# Altium project PGS-System.PrjPcb (part 14 of 16)

## Sheet IR-CUT_LIGHT SENSOR_SHEET.SchDoc
size A4; SheetNumber: 24; SheetTotal: 26
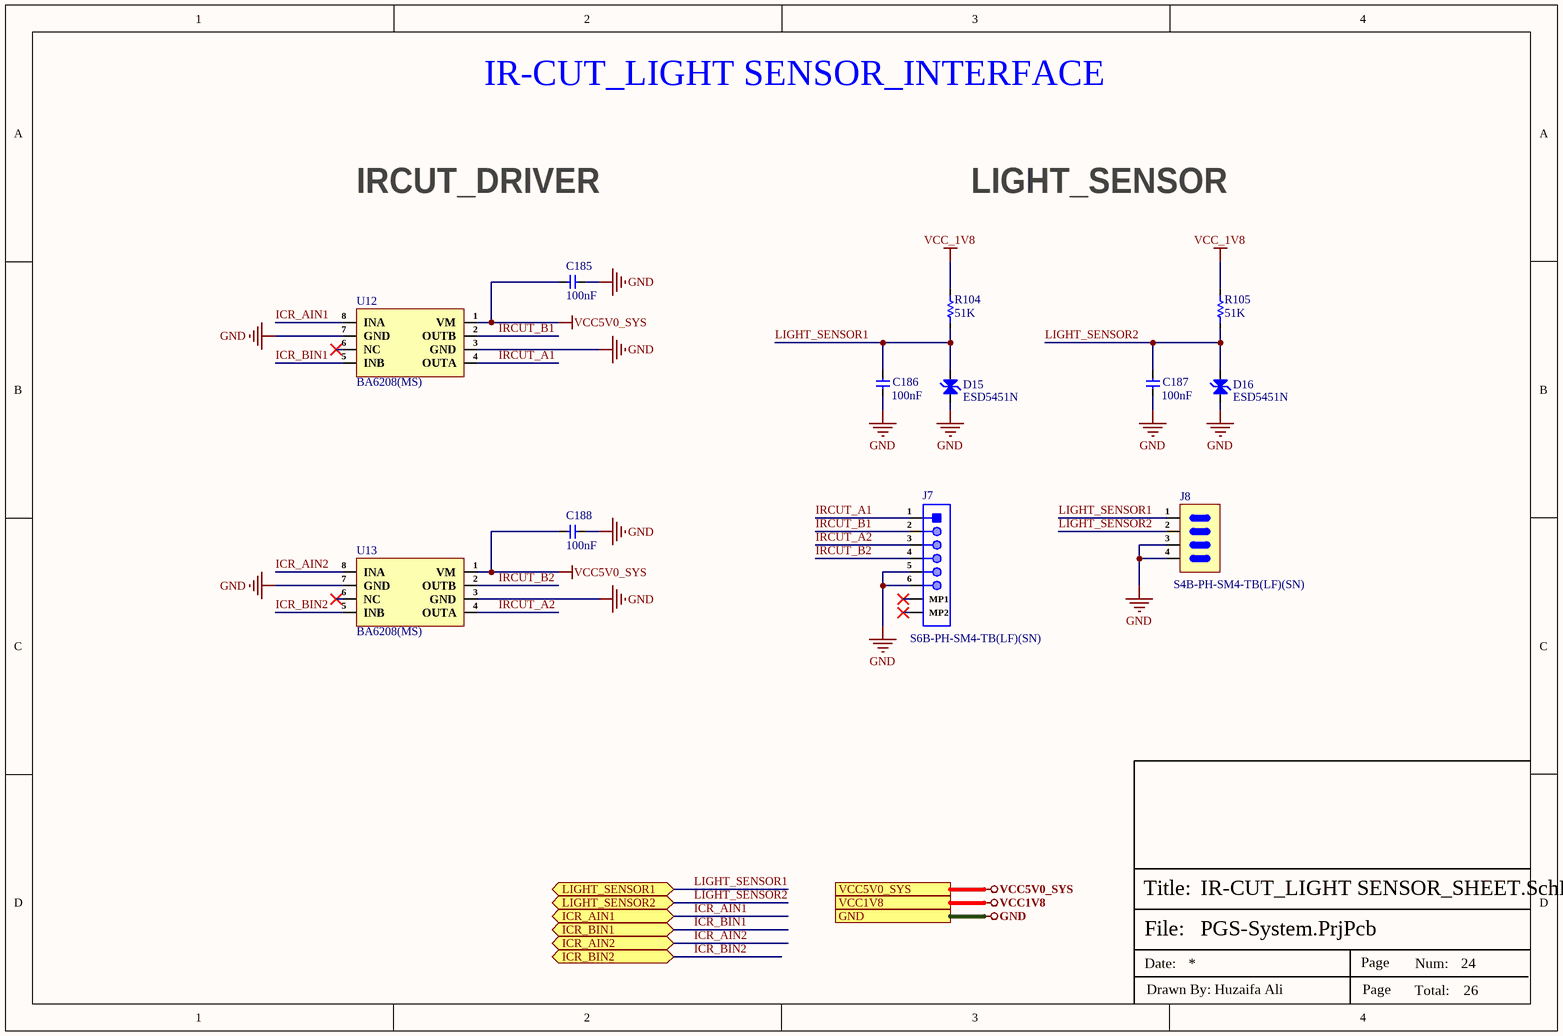
[diagram p25: IR-CUT_LIGHT SENSOR_SHEET.SchDoc]

### Parts
C185  100nF  [Cap-0402]
C186  100nF  [Cap-0402]
C187  100nF  [Cap-0402]
C188  100nF  [Cap-0402]
D15  ESD5451N  [DFN1006-2L (Bi-Directional)]
D16  ESD5451N  [DFN1006-2L (Bi-Directional)]
J7  S6B-PH-SM4-TB(LF)(SN)  [S6B-PH-SM4-TB(LF)(SN)]
J8  S4B-PH-SM4-TB(LF)(SN)  [S4B-PH-SM4-TB(LF)(SN)]
R104  51K  [Res-0402]
R105  51K  [Res-0402]
U12  BA6208(MS)  [SOIC-8(0.154", 3.90mm Width)]
U13  BA6208(MS)  [SOIC-8(0.154", 3.90mm Width)]

### Ports
GND (see DDR3_SDRAM_INTERFACE[4D], DEBUG_UART_INTERFACE[3D], DIGITAL_MEMS_MIC_INTERFACE[3D], eMMC_INTERFACE[3D], ETHERNET_SWITCH_INTERFACE[5C], MIPI TO HDMI_MODULE_INTERFACE[3D], MIPI-CSI_RXX_INTERFACE[4C], PoE PD INTERFACE[3D], PoE_PSE_CONTROLLER[5D], POWER_LDO_SHEET[3D], POWER_PMIC_RK809_CODEC[3D], POWER_PMIC_RK809_DC DC[3D], POWER_PMIC_RK809_LDO[4C], POWER_PMIC_RK809_MANAGEMENT[3D], RV1126_AUDIO_SHEET[3D], RV1126_DRAM_SHEET[4C], RV1126_eMMC_SPI-FLASH_SHEET[3D], RV1126_ETHERNET_SHEET[3D], RV1126_OSC-PLL-PMUIO[3C], RV1126_POWER_SHEET[1D], RV1126_SARADC_SHEET[3C], SPI_FLASH_INTERFACE[3D], SYNCHRONOUS _BUCK_CONTROLLER[3D], USB2.0_DEBUG_UART[3D], WIFI_AP6256_SHEET[4D]), ICR_AIN1 (bidir, see RV1126_SARADC_SHEET[3D]), ICR_AIN2 (bidir, see RV1126_SARADC_SHEET[3D]), ICR_BIN1 (bidir, see RV1126_SARADC_SHEET[3D]), ICR_BIN2 (bidir, see RV1126_SARADC_SHEET[3D]), LIGHT_SENSOR1 (bidir, see RV1126_SARADC_SHEET[3D]), LIGHT_SENSOR2 (bidir, see RV1126_SARADC_SHEET[3D]), VCC1V8 (see DIGITAL_MEMS_MIC_INTERFACE[3D], MIPI TO HDMI_MODULE_INTERFACE[3D], MIPI-CSI_RXX_INTERFACE[4C], POWER_PMIC_RK809_LDO[4C], POWER_PMIC_RK809_MANAGEMENT[3D], RV1126_AUDIO_SHEET[3D], RV1126_ETHERNET_SHEET[3D], RV1126_OSC-PLL-PMUIO[3C], RV1126_SARADC_SHEET[3C], USB2.0_DEBUG_UART[3D], WIFI_AP6256_SHEET[4D]), VCC5V0_SYS (see MIPI TO HDMI_MODULE_INTERFACE[3D], POWER_LDO_SHEET[3D], POWER_PMIC_RK809_CODEC[3D], POWER_PMIC_RK809_DC DC[3D], POWER_PMIC_RK809_LDO[4C], POWER_PMIC_RK809_MANAGEMENT[3D], RV1126_OSC-PLL-PMUIO[3C], SYNCHRONOUS _BUCK_CONTROLLER[3D], USB2.0_DEBUG_UART[3D])

### Nets
GND: C185.1 C186.1 C187.1 C188.1 D15.1(K) D16.1(K) J7.5 J7.6 J8.3 J8.4 U12.3(GND) U12.7(GND) U13.3(GND) U13.7(GND) ; port GND  [project net KSENSD]
VCC5V0_SYS: C185.2 C188.2 U12.1(VM) U13.1(VM) ; port VCC5V0_SYS
VCC_1V8: R104.2 R105.2
ICR_AIN1: U12.8(INA) ; port ICR_AIN1
ICR_AIN2: U13.8(INA) ; port ICR_AIN2
ICR_BIN1: U12.5(INB) ; port ICR_BIN1
ICR_BIN2: U13.5(INB) ; port ICR_BIN2
IRCUT_A1: J7.1 U12.4(OUTA)
IRCUT_A2: J7.3 U13.4(OUTA)
IRCUT_B1: J7.2 U12.2(OUTB)
IRCUT_B2: J7.4 U13.2(OUTB)
LIGHT_SENSOR1: C186.2 D15.2(K) J8.1 R104.1 ; port LIGHT_SENSOR1
LIGHT_SENSOR2: C187.2 D16.2(K) J8.2 R105.1 ; port LIGHT_SENSOR2

Not connected (* = marked no-connect by the designer): J7 MP1* MP2*; U12 6(NC)*; U13 6(NC)*

### Notes on the sheet
- IR-CUT_LIGHT SENSOR_INTERFACE
- IRCUT_DRIVER
- LIGHT_SENSOR
- File:
- Title:
- Date:
- Page
- Num:
- Total:
- Drawn By: Huzaifa Ali

### Library data of the parts
C185-C188 = CC0402KRX5R7BB104: as C121 on sheet ETH_SWITCH_INTERFACE; Supplier 1: Mouser; Manufacturer Part Number: CC0402KRX5R7BB104; RoHS: Yes; Category: Ceramic Capacitors; Stock 1: 936792; Pricing 1: 1=0.10000, 10=0.02300, 50=0.02300, 100=0.01100, 1000=0.00600, 10000=0.00400 (USD); Mount: Surface Mount; Case/Package: 0402; Case Code (Imperial): 0402; Case Code (Metric): 1005; Min Operating Temperature: -55°C; Max Operating Temperature: 85°C; Capacitance: 100nF; Packaging: Tape and Reel; Voltage Rating: 16V; Dielectric: X5R; Termination: SMD/SMT; Voltage Rating (DC): 16V; Package Quantity: 1; Length: 1mm; Width: 0.02inch; Thickness: 0.022inch; Lead Free: Lead Free; Halogen Free: Halogen Free; ComponentLink1URL: https://datasheet.ciiva.com/155/mlccorderingcode-155879.pdf?src-supplier=Digi-Key; ComponentLink1Description: https://datasheet.ciiva.com/155/mlccorderingcode-155879.pdf?src-supplier=Digi-Key; ComponentLink2URL: https://datasheet.ciiva.com/155/mlccorderingcode-155878.pdf?src-supplier=Digi-Key; ComponentLink2Description: https://datasheet.ciiva.com/155/mlccorderingcode-155878.pdf?src-supplier=Digi-Key; ComponentLink3URL: https://datasheet.ciiva.com/155/mlccorderingcode-155880.pdf?src-supplier=Digi-Key; ComponentLink3Description: https://datasheet.ciiva.com/155/mlccorderingcode-155880.pdf?src-supplier=Digi-Key; Supplier Part Number 1: 603-CC402KRX5R7BB104; LCSC Part Number: C106204; Number of Pins: 2; Resistor Type: Ceramic; Series: CC; Construction: Flat; Height: 0.5mm; Depth: 0.5mm; Radiation Hardening: No; REACH SVHC: Unknown; RoHS Compliant: Yes; ComponentLink4URL: https://datasheet.ciiva.com/11464/upy-gphc-x5r-4v-to-50v-12-11464869.pdf?src-supplier=Avnet; ComponentLink4Description: https://datasheet.ciiva.com/11464/upy-gphc-x5r-4v-to-50v-12-11464869.pdf?src-supplier=Avnet
D15 D16 = ESD5451N: as D33 on sheet SPEARKER_INTERFACE_SHEET; Manufacturer Part Number: ESD5451N; Footprint: DFN1006-2(0402); ComponentLink1Description: LCSC; ComponentLink1URL: https://www.lcsc.com/product-detail/span-style-background-color-ff0-ESD-span-Protection-Devices_TECH-PUBLIC-ESD5451N_C2936977.html; LCSC Part Number: C2936977
J7 = S6B-PH-SM4-TB(LF)(SN): CONN HEADER SMD R/A 6POS 2MM; Manufacturer: JST; Contact Resistance: 20mR; Max Current Rating: 2A; Number of Poles: 6; Voltage Rating (AC): 100V; Insulation Resistance: 1GR; Gender: Male; Item Type: JST Connector; Supplier 1: Rs; Manufacturer Part Number: S6B-PH-SM4-TB(LF)(SN); RoHS: Yes; Category: Connectors; Stock 1: 8280; Pricing 1: 125=0.16040, 500=0.65000, 2500=0.61200, 5000=0.58600 (GBP); Mounting Technology: Surface Mount; Contact Material: Copper Alloy,Tin,Bronze,Brass; Contact Plating: Tin,Copper; Color: White; Housing Color: Beige; Housing Material: Polyamide; Contact Shape: Square; Insulation Material: Nylon; Insulation Color: Natural; Contact Finish - Mating: TIN; Min Operating Temperature: -25°C; Max Operating Temperature: 85°C; Number of Rows: 1; Packaging: Tape and Reel; Current Rating: 2A; Voltage Rating: 100V; Number of Positions: 6; Termination: Solder; Fastening Type: Detent; Max Voltage Rating (AC): 100V; Number of Contacts: 6; Working Voltage: 100V; Max Voltage Rating (DC): 100V; Orientation: Right Angle; Connector Type: Header; Series: PH; Contact Type: Male Pin; Length: 15.9mm; Width: 5mm; Height: 9.4mm; Lead Pitch: 2mm; Pitch: 2mm; Contact Mating Length: 0.13inch; Depth: 7.6mm; Reach SVHC Compliant: Yes; Lead Free: Lead Free; Flammability Rating: UL94 V-0; ComponentLink1URL: https://datasheet.ciiva.com/11747/0900766b80df0d9d-11747278.pdf?src-supplier=Rs; ComponentLink1Description: https://datasheet.ciiva.com/11747/0900766b80df0d9d-11747278.pdf?src-supplier=Rs; ComponentLink2URL: https://datasheet.ciiva.com/8052/1699381-8052221.pdf?src-supplier=Element14; ComponentLink2Description: https://datasheet.ciiva.com/8052/1699381-8052221.pdf?src-supplier=Element14; ComponentLink3URL: https://datasheet.ciiva.com/712/eph-712622.pdf?src-supplier=Digi-Key; ComponentLink3Description: https://datasheet.ciiva.com/712/eph-712622.pdf?src-supplier=Digi-Key; ComponentLink4URL: https://datasheet.ciiva.com/712/eph-712623.pdf?src-supplier=Digi-Key; ComponentLink4Description: https://datasheet.ciiva.com/712/eph-712623.pdf?src-supplier=Digi-Key; ComponentLink5URL: https://datasheet.ciiva.com/730/eph-730589.pdf?src-supplier=Digi-Key; ComponentLink5Description: https://datasheet.ciiva.com/730/eph-730589.pdf?src-supplier=Digi-Key; ComponentLink6URL: https://datasheet.ciiva.com/16340/jsts6b-ph-sm4-tb-lf-sn-16340154.pdf?src-supplier=Future+Electronics; ComponentLink6Description: https://datasheet.ciiva.com/16340/jsts6b-ph-sm4-tb-lf-sn-16340154.pdf?src-supplier=Future+Electronics; Supplier Part Number 1: 6881369P; LCSC Part Number: C265405
J8 = S4B-PH-SM4-TB(LF)(SN): CONN HEADER SMD R/A 4POS 2MM; Manufacturer: JST; Item Type: Connectors; Gender: 29Gender; Supplier: Future Electronics; Supplier Part Number: 7687031; Manufacturer Part Number: S4B-PH-SM4-TB(LF)(SN); RoHS: Yes; Stock: 78; Pricing: 1=0.935, 10=0.83, 40=0.77, 150=0.71, 500=0.655 (USD); ComponentLink1URL: https://datasheet.ciiva.com/11746/0900766b80df0d9d-11746552.pdf?src-supplier=Rs; ComponentLink1Description: https://datasheet.ciiva.com/11746/0900766b80df0d9d-11746552.pdf?src-supplier=Rs; ComponentLink2URL: https://datasheet.ciiva.com/712/eph-712578.pdf?src-supplier=Digikey; ComponentLink2Description: https://datasheet.ciiva.com/712/eph-712578.pdf?src-supplier=Digikey; ComponentLink3URL: https://datasheet.ciiva.com/712/eph-712579.pdf?src-supplier=Digikey; ComponentLink3Description: https://datasheet.ciiva.com/712/eph-712579.pdf?src-supplier=Digikey; ComponentLink4URL: https://datasheet.ciiva.com/730/eph-730675.pdf?src-supplier=Digikey; ComponentLink4Description: https://datasheet.ciiva.com/730/eph-730675.pdf?src-supplier=Digikey; ComponentLink5URL: https://datasheet.ciiva.com/8052/1699381-8052234.pdf?src-supplier=Element14; ComponentLink5Description: https://datasheet.ciiva.com/8052/1699381-8052234.pdf?src-supplier=Element14; LCSC Part Number: C265102
R104 R105 = RC0402FR-0751KL: RES 51K OHM 1% 1/16W 0402; Manufacturer: Yageo; Power Rating: 63mW; Temperature Coefficient: 100ppm/°C; Value: 51kR; Voltage Rating: 50V; Item Type: Resistor; Supplier 1: Future Electronics; Manufacturer Part Number: RC0402FR-0751KL; RoHS: Yes; Category: Chip SMD Resistors; Stock 1: 610000; Pricing 1: 10000=0.00100, 50000=0.00100, 300000=0.00090, 1000000=0.00090, 3000000=0.00080 (USD); Case/Package: 0402; Case Code (Imperial): 0402; Case Code (Metric): 1005; Min Operating Temperature: -55°C; Max Operating Temperature: 155°C; Tolerance: 1%; Technology: THICK FILM; Packaging: Cut Tape; Package Quantity: 1; Termination: SMD/SMT; Resistor Type: Thick Film; Number of Terminations: 2; Max Power Dissipation: 63mW; Voltage Rating (DC): 50V; Working Voltage: 50V; Features: Moisture Resistant; Series: RC; Resistance Tolerance: 1%; Construction: Rectangular; Length: 0.039inch; Width: 0.02inch; Height: 0.016inch; Depth: 0.5mm; RoHS Compliant: Yes; Military Standard: Not; Lead Free: Lead Free; ComponentLink1URL: https://datasheet.ciiva.com/7850/1018594-7850037.pdf?src-supplier=Element14; ComponentLink1Description: https://datasheet.ciiva.com/7850/1018594-7850037.pdf?src-supplier=Element14; ComponentLink2URL: https://datasheet.ciiva.com/2519/pyu-r-int-thick-7-2519211.pdf?src-supplier=Digi-Key; ComponentLink2Description: https://datasheet.ciiva.com/2519/pyu-r-int-thick-7-2519211.pdf?src-supplier=Digi-Key; ComponentLink3URL: https://datasheet.ciiva.com/2519/pyu-r-int-thick-7-2519212.pdf?src-supplier=Digi-Key; ComponentLink3Description: https://datasheet.ciiva.com/2519/pyu-r-int-thick-7-2519212.pdf?src-supplier=Digi-Key; ComponentLink4URL: https://datasheet.ciiva.com/2519/pyu-r-int-thick-7-2519210.pdf?src-supplier=Digi-Key; ComponentLink4Description: https://datasheet.ciiva.com/2519/pyu-r-int-thick-7-2519210.pdf?src-supplier=Digi-Key; Supplier Part Number 1: 6056592; LCSC Part Number: C107229
U12 U13 = BA6208(MS): SOIC-8 Brushed DC Motor Drivers ROHS; Manufacturer: MSKSEMI; Item Type: IC; Manufacturer Part Number: BA6208(MS); Package: SOIC-8; LCSC Part Number: C20627211; ComponentLink1Description: LCSC; ComponentLink1URL: https://www.lcsc.com/product-detail/Brushed-DC-Motor-Drivers_MSKSEMI-BA6208-MS_C20627211.html